# EAGLE design LPC_4TE_TOP (EAGLE 5.04)
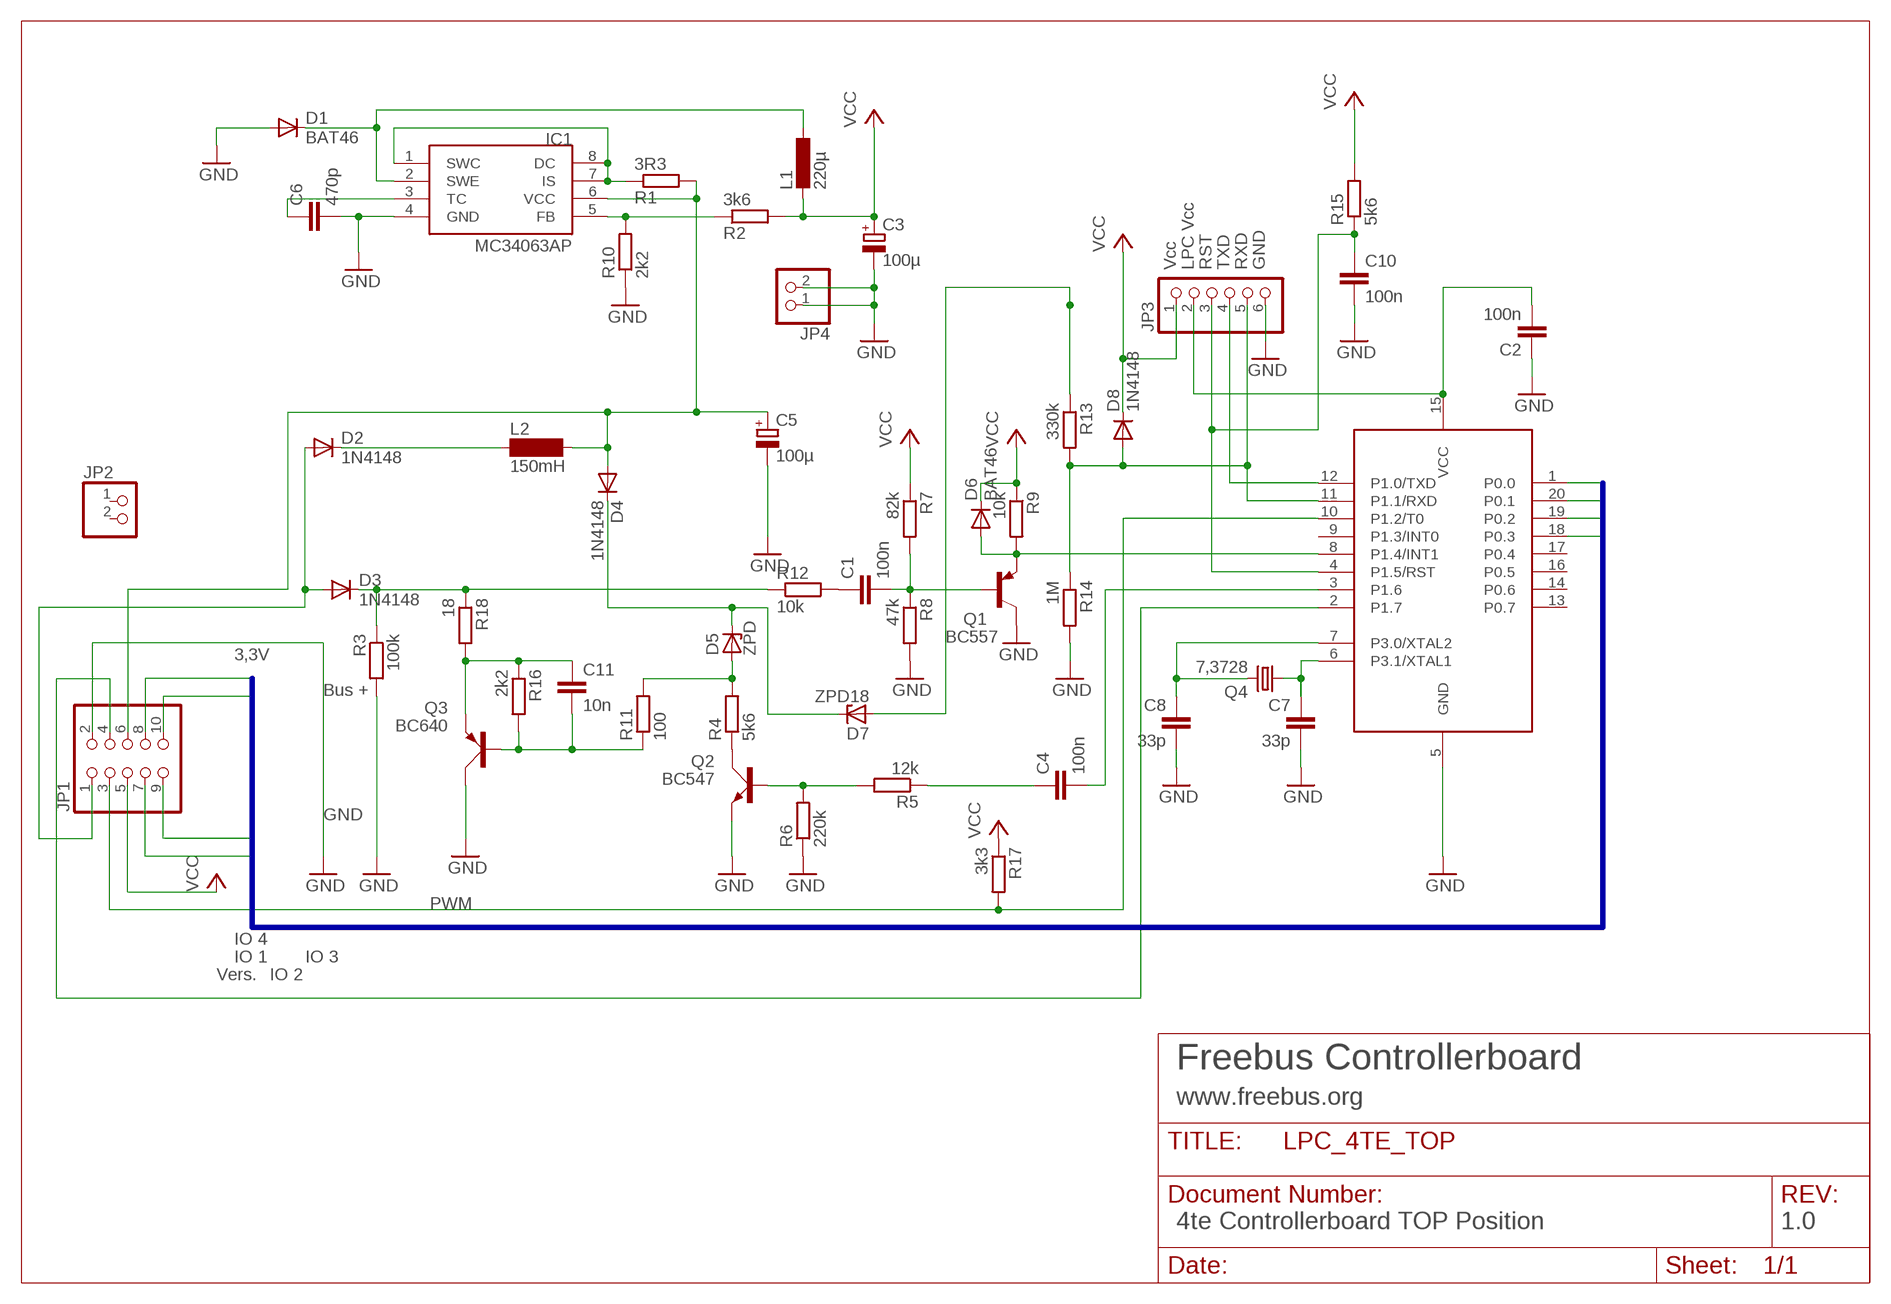
[diagram p0: schematic, sheet 1]

## Parts
89LPC922  89LPC922  [DIL20]
C1  100n  C-EU050-024X044  [C050-024X044]
C2  100n  C-EU050-024X044  [C050-024X044]
C3  100µ  CPOL-EUE2.5-6  [E2,5-6]
C4  100n  C-EU050-024X044  [C050-024X044]
C5  100µ  CPOL-EUE3.5-8  [E3,5-8]
C6  470p  C-EU025-024X044  [C025-024X044]
C7  33p  C-EU025-024X044  [C025-024X044]
C8  33p  C-EU025-024X044  [C025-024X044]
C10  100n  C-EU050-024X044  [C050-024X044]
C11  10n  C-EU050-024X044  [C050-024X044]
D1  BAT46  BAT81  [DO34-7]
D2  1N4148  [DO35-10]
D3  1N4148  [DO35-10]
D4  1N4148  [DO35-10]
D5  ZPD  [DO35Z10]
D6  BAT46  1N4148  [DO35-10]
D7  ZPD18  ZPD  [DO35Z10]
D8  1N4148  [DO35-10]
IC1  MC34063AP  [DIL08]
JP1  PINHD-2X5  [2X05]
JP2  PINHD-1X2  [1X02]
JP3  PINHD-1X6  [1X06]
JP4  PINHD-1X2  [1X02]
L1  220µ  L-EU0207/12  [0207/12]
L2  150mH  BS11  [BS11]
Q1  BC557  [TO92]
Q2  BC547  [SOT54A]
Q3  BC640  [SOT54D]
Q4  7,3728  CRYSTALHC49S  [HC49/S]
R1  3R3  R-EU_0204/7  [0204/7]
R2  3k6  R-EU_0204/7  [0204/7]
R3  100k  R-EU_0207/2V  [0207/2V]
R4  5k6  R-EU_0207/2V  [0207/2V]
R5  12k  R-EU_0204/7  [0204/7]
R6  220k  R-EU_0207/2V  [0207/2V]
R7  82k  R-EU_0204/7  [0204/7]
R8  47k  R-EU_0207/2V  [0207/2V]
R9  10k  R-EU_0204/7  [0204/7]
R10  2k2  R-EU_0204/7  [0204/7]
R11  100  R-EU_0207/2V  [0207/2V]
R12  10k  R-EU_0207/2V  [0207/2V]
R13  330k  R-EU_0207/2V  [0207/2V]
R14  1M  R-EU_0207/2V  [0207/2V]
R15  5k6  R-EU_0207/2V  [0207/2V]
R16  2k2  R-EU_0207/2V  [0207/2V]
R17  3k3  R-EU_0204/7  [0204/7]
R18  18  R-EU_0207/2V  [0207/2V]

## Nets
/RESET: 89LPC922.4(P1.5/RST) C10.1 JP3.3 R15.1
EIB+: D2.A D3.A JP1.1
GND: 89LPC922.5(GND) C2.1 C3.- C5.- C6.2 C7.2 C8.2 C10.2 D1.A IC1.4(GND) JP1.2 JP3.6 JP4.1 JP4.2 Q1.3(C) Q2.E Q3.C R3.2 R6.1 R8.2 R10.1 R14.2
N$1: 89LPC922.8(P1.4/INT1) D6.A Q1.1(E) R9.2
N$2: C1.2 Q1.2(B) R7.2 R8.1
N$3: 89LPC922.7(P3.0/XTAL2) C8.1 Q4.2
N$4: D3.C R3.1 R12.1 R18.1
N$5: 89LPC922.3(P1.6) C4.2
N$6: 89LPC922.6(P3.1/XTAL1) C7.1 Q4.1
N$7: Q2.B R5.2 R6.2
N$8: IC1.1(SWC) IC1.7(IS) IC1.8(DC) R1.1
N$10: 89LPC922.11(P1.1/RXD) D8.A JP3.5 R13.2 R14.1
N$11: IC1.5(FB) R2.1 R10.2
N$12: D1.C IC1.2(SWE) L1.1
N$13: D2.C L2.1
N$14: C6.1 IC1.3(TC)
N$15: D4.C D5.C D7.C
N$16: C1.1 R12.2
N$17: C4.1 R5.1
N$18: Q2.C R4.1
N$19: D5.A R4.2 R11.2
N$20: C11.1 Q3.E R16.1 R18.2
N$25: D7.A R13.1
N$28: C11.2 Q3.B R11.1 R16.2
N$29: 89LPC922.12(P1.0/TXD) JP3.4
N$32: 89LPC922.15(VCC) C2.2 JP3.2
P0.0: 89LPC922.1(P0.0) JP1.7
P0.1: 89LPC922.20(P0.1) JP1.8
P0.2: 89LPC922.19(P0.2) JP1.9
P0.3: 89LPC922.18(P0.3) JP1.10
PROG: 89LPC922.2(P1.7) JP1.4
PWM: 89LPC922.10(P1.2/T0) JP1.3 R17.2
VCC: C3.+ D6.C D8.C JP1.5 JP3.1 L1.2 R2.2 R7.1 R9.1 R15.2 R17.1
VERS: C5.+ D4.A IC1.6(VCC) JP1.6 L2.2 R1.2
Unconnected: 89LPC922.9(P1.3/INT0) 89LPC922.13(P0.7) 89LPC922.14(P0.6) 89LPC922.16(P0.5) 89LPC922.17(P0.4) JP2.1 JP2.2

## Buses
P0.[0..3]

## Notes on the sheet
- Vcc | LPC Vcc | RST | TXD | RXD | GND
- 3,3V
- Bus +
- GND
- PWM
- IO 4
- IO 1 | IO 3
- Vers. | IO 2
- Freebus Controllerboard
- www.freebus.org
- 4te Controllerboard TOP Position | 1.0

## Library data of the parts
89LPC922 = micro-philips:89LPC922
C1 C2 C4 C6-C8 C10 C11 = rcl:C-EU: CAPACITOR, European symbol
C3 C5 = rcl:CPOL-EU: POLARIZED CAPACITOR, European symbol
D1 = diode:BAT81: DIODE barrier diode
D2-D4 D6 D8 = diode:1N4148: DIODE high speed (Philips)
D5 D7 = diode:ZPD: Z DIODE 500 mW
IC1 = mc34063:MC34063
JP1 = pinhead:PINHD-2X5: PIN HEADER
JP2 JP4 = pinhead:PINHD-1X2: PIN HEADER
JP3 = pinhead:PINHD-1X6: PIN HEADER
L1 = rcl:L-EU: INDUCTOR, European symbol
L2 = inductor-neosid:BS: INDUCTOR nominal inductance, magnetically screened
Q1 = transistor-pnp:BC557: PNP Transistor
Q2 = transistor-small-signal:BC547: NPN TRANSISTOR
Q3 = transistor-small-signal:BC640: PNP TRANSISTOR
Q4 = crystal:CRYSTAL: CRYSTAL
R1-R18 = rcl:R-EU_: RESISTOR, European symbol

## Board
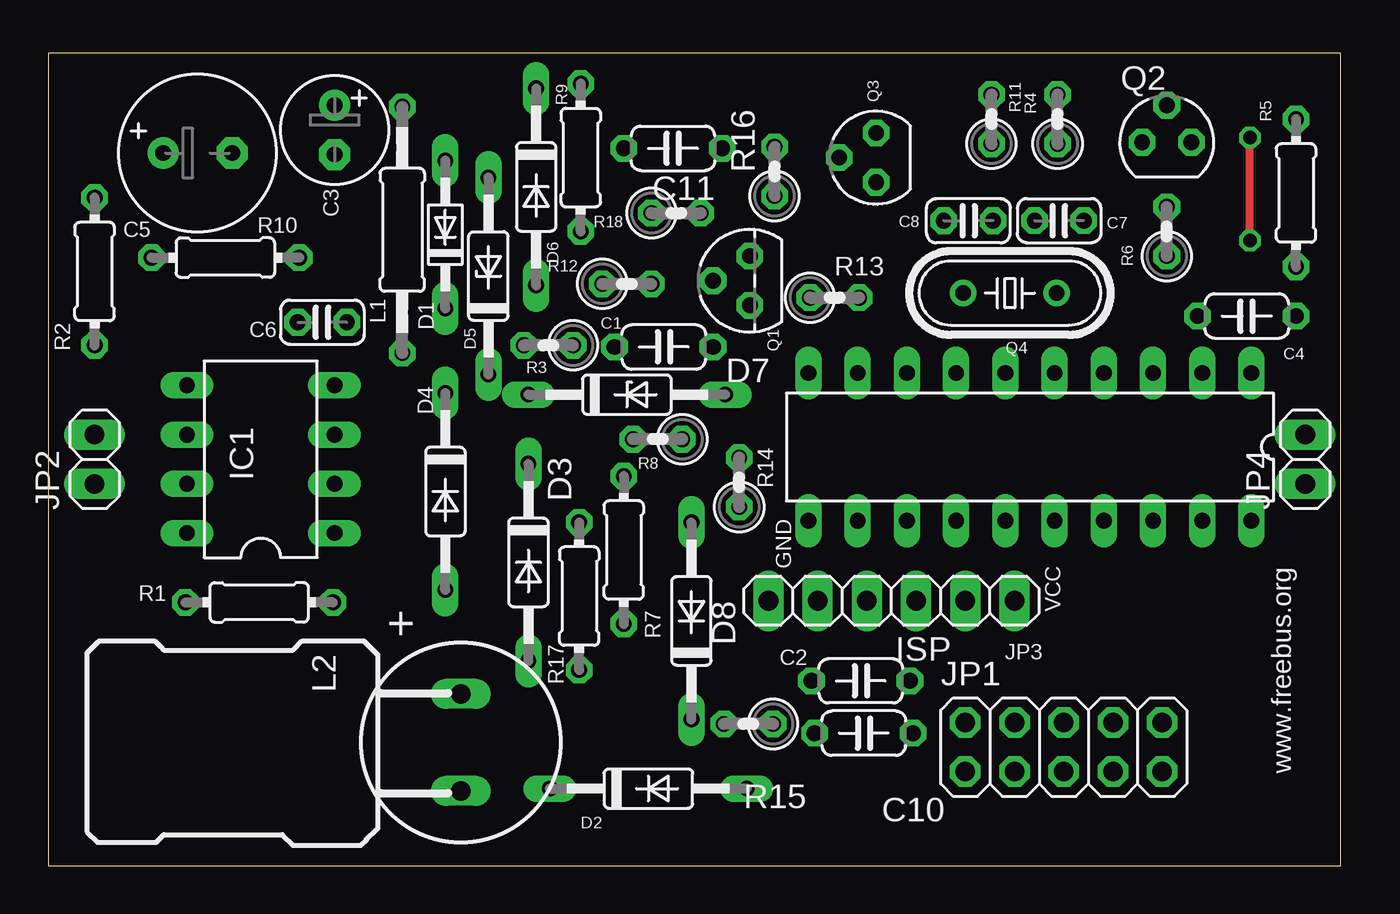
[diagram p1: board, top side]
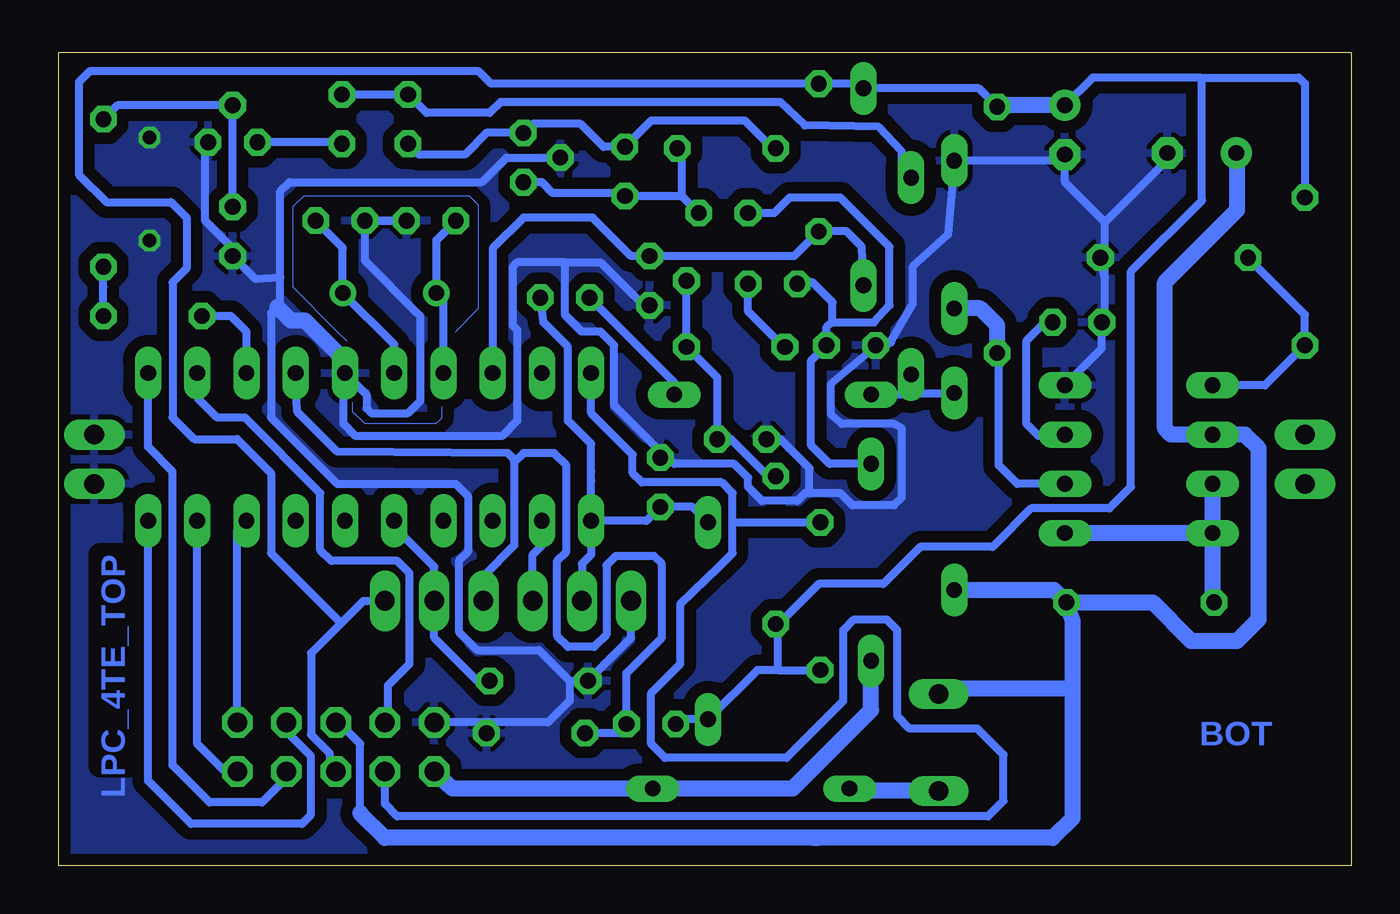
[diagram p2: board, bottom side, seen from below]

Size 66.68 x 41.91 mm. Coordinates in mm from the lower left corner, seen from the top.
Outline: 0,41.91 0,0 66.68,0 66.68,41.91 0,41.91
Copper layers (1*16): Top 0.035mm / dielectric 1.5mm / Bottom 0.035mm
Design rules "default_freebus": minimum track width 10mil, minimum drill 24mil, track to track 8mil, track to pad 8mil, pad to pad 8mil, via to via 8mil, smd to smd 8mil, copper to edge 12mil, drill to drill 8mil, minimum pad ring 11mil, minimum via ring 8mil, stop-mask expansion 4mil, vias tented up to drill 0mil, thermal gap 10mil

### Footprints (pad centres in the part's own frame; a part is rotated, then mirrored left to right if it is on the bottom)
DIL20@1 = drill 0.813 long: 1 -11.43,-3.81; 2 -8.89,-3.81; 3 -6.35,-3.81; 4 -3.81,-3.81; 5 -1.27,-3.81; 6 1.27,-3.81; 7 3.81,-3.81; 8 6.35,-3.81; 9 8.89,-3.81; 10 11.43,-3.81; 11 11.43,3.81; 12 8.89,3.81; 13 6.35,3.81; 14 3.81,3.81; 15 1.27,3.81; 16 -1.27,3.81; 17 -3.81,3.81; 18 -6.35,3.81; 19 -8.89,3.81; 20 -11.43,3.81
C050-024X044 = drill 0.813 octagon: 1 -2.54,0; 2 2.54,0
E2,5-6 = drill 0.813 pad 1.6 round: + -1.27,0 | drill 0.813 pad 1.6 octagon: - 1.27,0
E3,5-8 = drill 0.813 pad 1.6 round: + -1.778,0 | drill 0.813 pad 1.6 octagon: - 1.778,0
C025-024X044 = drill 0.813 octagon: 1 -1.27,0; 2 1.27,0
DO34-7 = drill 0.813 long: A 3.81,0; C -3.81,0
DO35-10 = drill 0.813 long: A 5.08,0; C -5.08,0
DO35Z10 = drill 0.813 long: A 5.08,0; C -5.08,0
DIL08 = drill 0.813 long: 1 -3.81,-3.81; 2 -1.27,-3.81; 3 1.27,-3.81; 4 3.81,-3.81; 5 3.81,3.81; 6 1.27,3.81; 7 -1.27,3.81; 8 -3.81,3.81
2X05 = drill 1.016 octagon: 1 -5.08,-1.27; 2 -5.08,1.27; 3 -2.54,-1.27; 4 -2.54,1.27; 5 0,-1.27; 6 0,1.27; 7 2.54,-1.27; 8 2.54,1.27; 9 5.08,-1.27; 10 5.08,1.27
1X02 = drill 1.016 long: 1 -1.27,0; 2 1.27,0
1X06 = drill 1.016 long: 1 -6.35,0; 2 -3.81,0; 3 -1.27,0; 4 1.27,0; 5 3.81,0; 6 6.35,0
0207/12 = drill 0.813 octagon: 1 -6.35,0; 2 6.35,0
BS11 = drill 1 long: 1 -2.5,0; 2 2.5,0
TO92 = drill 0.813 octagon: 1 1.27,0; 2 0,1.905; 3 -1.27,0
SOT54A = drill 0.813 octagon: B 0,1.905; C -1.27,0; E 1.27,0
SOT54D = drill 0.813 octagon: B 1.27,0; C 0,1.905; E -1.27,0
HC49/S = drill 0.813 round: 1 -2.413,0; 2 2.413,0
0204/7 = drill 0.813 octagon: 1 -3.81,0; 2 3.81,0
0207/2V = drill 0.813 octagon: 1 -1.27,0; 2 1.27,0

### Placement (x,y rotation side)
89LPC922  89LPC922  [DIL20@1]  50.64,21.59 180 top
C1  31.75,26.75 0 top
C2  41.91,9.53 0 top
C3  14.76,37.94 270 top
C4  61.83,28.34 180 top
C5  7.7,36.75 0 top
C6  14.13,28.02 180 top
C7  52.15,33.26 180 top
C8  47.47,33.26 0 top
C10  42.07,6.83 0 top
C11  32.23,36.99 180 top
D1  20.48,32.54 90 top
D2  30.96,3.97 0 top
D3  24.76,15.64 270 top
D4  20.48,19.29 270 top
D5  22.7,30.4 90 top
D6  25.16,35.01 270 top
D7  29.84,24.29 0 top
D8  33.18,12.62 90 top
IC1  10.95,20.96 90 top
JP1  52.39,6.11 0 top
JP2  2.38,20.96 90 top
JP3  43.5,13.65 180 top
JP4  64.85,20.96 90 top
L1  18.26,32.78 90 top
L2  21.27,6.35 90 top
Q1  36.19,30.16 90 top
Q2  57.7,37.31 0 top
Q3  42.7,36.51 90 top
Q4  49.61,29.53 180 top
R1  10.87,13.57 0 top
R2  2.38,30.64 90 top
R3  25.8,26.83 180 top
R4  52.07,38.5 90 top
R5  64.37,34.69 90 top
R6  57.7,32.7 90 top
R7  29.69,16.27 90 top
R8  31.43,21.99 180 top
R9  27.46,36.51 270 top
R10  9.13,31.35 180 top
R11  48.66,38.5 90 top
R12  29.84,30 0 top
R13  40.56,29.29 0 top
R14  35.64,19.76 90 top
R15  36.12,7.3 180 top
R16  37.46,35.8 90 top
R17  27.38,13.89 90 top
R18  32.38,33.66 0 top

### Tracks (layer width: path | path; a pad name or v marks a point on that pad's centre or on a via)
/RESET
  Bottom 0.406: 89LPC922.4 54.37,23.42 52.31,21.35 43.5,21.27 43.18,20.96 43.18,20.8 | 43.18,20.8 43.18,16.51 44.77,14.92 JP3.3 | 43.18,20.8 42.7,21.27 41.12,21.27 40.48,20.64 40.48,16.19 40.96,15.72 40.96,11.83 40.4,11.27 39.05,11.27 38.42,11.91 38.42,15.48 37.94,15.95 35.96,15.95 35.56,15.56 35.56,11.75 37.39,9.92 R15.1 37.31,6.83 C10.1
EIB+
  Bottom 0.813: JP1.1 46.35,3.97 40.8,3.97 D2.A 28.81,3.97 24.76,8.02 D3.A 24.76,10.24
GND  (via drill 0.7)  (1 unrouted)
  Top 0.406: v61.99,32.23 v61.99,37.54
  Bottom 0.406: 40.32,9.53 40.32,8.49 41.43,7.38 44.61,7.38 | 40.32,9.53 41.91,11.11 45.08,11.11 46.04,12.07 46.04,12.54 46.04,15.72 45.56,16.19 45.56,19.05 46.2,19.69 52.31,19.69 55.72,23.1 55.72,28.5 55.4,28.81 55.24,28.97 55.24,30.32 | 44.61,7.38 JP1.2 | JP1.2 | 89LPC922.5 51.91,25.72 | 12.7,33.18 14.76,35.24 C3.- 15.08,36.35 D1.A 20.8,32.54 22.62,30.88 22.62,28.97 23.73,27.07 | 12.7,30.32 12.7,33.18 | 12.7,30.32 R10.1 | C5.- 9.48,36.4 12.7,33.18 | C10.2 | 44.61,7.38 C10.2 | JP3.6 37.15,11.75 C2.1 40.32,9.53 | C7.2 C8.2 50.48,33.26 | C7.2 | R8.2 30.16,21.91 30.08,21.99 29.45,21.99 27.94,20.48 27.94,19.21 | R3.2 23.97,26.83 23.73,27.07 | 23.73,27.07 23.73,26.99 24.29,26.99 26.83,24.84 26.83,23.26 26.27,22.78 23.57,22.78 23.18,22.54 23.18,18.97 23.57,18.57 25.72,18.57 26.35,19.21 27.94,19.21 | IC1.4 12.86,26.67 C6.2 12.7,28.18 12.7,30.32 | Q3.C 43.58,36.51 44.85,35.24 54.77,35.24 55.24,34.77 55.24,30.32 | C7.2 | C7.2 50.88,31.19 48.18,28.5 48.02,28.34 48.02,23.97 48.66,23.34 50.56,23.34 50.8,23.57 50.8,24.29 89LPC922.5 | 89LPC922.5 51.99,25.32 51.99,22.78 51.35,22.15 43.81,22.15 43.02,22.94 43.02,27.62 43.26,27.86 43.26,30.88 43.02,31.12 40.56,31.12 | 89LPC922.5 | 55.24,30.32 56.51,30.24 R6.1 57.71,31.83 59.13,33.26 59.13,37.15 Q2.E | 40.32,9.53 | 27.94,19.21 28.18,19.21 28.57,18.81 30.4,18.81 31.11,19.53 31.11,20 31.83,20.72 34.92,20.72 35.24,21.03 R14.2 35.64,21.35 38.02,23.73 38.02,26.83 38.73,27.54 39.69,27.54 40.56,28.42 40.56,31.12 | Q1.3 36.51,28.89 38.73,31.12 40.56,31.12
  Bottom 0.813: 51.91,25.72 51.91,26.04 53.97,28.1 54.69,28.1 55.4,28.81
  pour Bottom (isolate 0.61): 0,42.23 67.15,42.23 67.15,-0.32 -0.4,-0.32 -0.4,41.99
N$1
  Bottom 0.406: 89LPC922.8 44.29,25.88 | 44.29,25.88 | 44.29,25.96 89LPC922.8 | 44.29,25.96 44.29,26.35 44.29,27.78 44.29,31.83 42.7,33.42 39.13,33.42 37.15,31.43 Q1.1 33.65,31.43 33.34,31.43 31.91,31.43 31.59,31.43 30.96,31.43 30.8,31.43 28.73,31.43 R9.2 26.03,32.7 25.24,31.91 D6.A | 89LPC922.8 44.21,25.48 | 44.53,25.88 44.37,25.88 44.29,25.96
N$2
  Bottom 0.406: Q1.2 34.29,27.46 C1.2 32.7,25.16 R8.1 31.99,21.99 30.08,20.08 R7.2
N$3
  Bottom 0.406: 89LPC922.7 46.83,29.16 Q4.2 47.2,32.26 C8.1
N$4
  Bottom 0.406: R12.1 28.26,30.08 27.78,30.08 26.75,29.05 26.75,28.02 | 26.75,28.02 24.61,28.02 23.81,28.89 23.81,31.91 26.35,34.45 28.97,34.45 29.77,33.66 R18.1 | 26.75,28.02 27.07,27.78 R3.1 27.86,26.04 27.86,21.67 26.91,20.72 D3.C
N$5
  Bottom 0.406: 89LPC922.3 56.99,27.54 57.78,28.34 C4.2
N$6
  Bottom 0.406: 89LPC922.6 49.37,26.88 Q4.1 52.02,31.86 C7.1
N$7
  Bottom 0.406: R5.2 63.66,39.21 Q2.B | Q2.B | R6.2 Q2.B
N$8
  Bottom 0.813: IC1.8 IC1.1 | IC1.8 IC1.7 | IC1.8 7.14,13.42 R1.1
N$9
  Bottom 0: 51.51,23.89 51.51,23.42 50.88,22.78 47.23,22.78 46.91,23.1 46.91,23.65
N$10
  Bottom 0.406: JP3.5 39.69,15.56 39.21,16.03 89LPC922.11 | 89LPC922.11 39.21,19.84 39.21,20.32 39.21,21.75 40.4,22.94 40.4,26.75 41.67,28.02 R13.2 | 89LPC922.11 36.35,17.78 R14.1 33.97,18.49 D8.A
N$11
  Bottom 0.406: R10.2 2.38,28.42 R2.1 4.45,24.77 IC1.5
N$12
  Bottom 0.406: IC1.2 17.22,19.68 18.18,20.64 18.18,26.43 L1.1
  Bottom 0.813: L1.1 18.26,27.86 19.13,28.73 D1.C | D1.C
N$13
  Bottom 0.813: D2.C 25.76,3.85 L2.1
N$14
  Bottom 0.406: IC1.3 14.84,22.15 16.11,22.15 16.75,22.78 16.75,27.07 15.8,28.02 C6.1
N$15
  Bottom 0.406: D7.C 22.7,24.29 22.7,24.37 | 22.7,24.37 D4.C | D5.C 22.7,24.37
N$16
  Bottom 0.406: C1.1 29.29,26.75 31.11,28.58 R12.2
N$17
  Bottom 0.406: R5.1 64.37,29.84 C4.1
N$18
  Bottom 0.406: R4.1 52.15,37.31 Q2.C
N$19
  Bottom 0.406: D5.A 23.18,36.2 23.18,36.83 24.37,38.1 28.18,38.18 29.45,39.37 43.89,39.37 44.45,38.81 47.7,38.81 R11.2 51.75,39.77 R4.2
N$20
  Bottom 0.406: R18.2 34.53,34.53 | 34.53,34.53 R16.1 37.62,34.69 41.2,34.69 41.75,35.24 Q3.E | C11.1 34.53,36.75 34.53,34.53
N$21
  Bottom 0: 51.83,27.07 52.31,27.54 54.61,29.85 54.61,33.97 54.05,34.53 45.48,34.53 45.01,34.05 45.01,28.73 46.2,27.54
N$25
  Bottom 0.406: R13.1 34.92,24.92 D7.A
N$28
  Bottom 0.406: R11.1 48.1,36.67 45.72,36.67 44.61,37.78 Q3.B 42.23,38.26 39.77,38.26 38.58,37.07 R16.2 36.12,38.42 31.27,38.42 29.84,36.99 C11.2
N$29
  Bottom 0.406: JP3.4 42.23,16.03 41.75,16.51 89LPC922.12
N$32
  Bottom 0.406: JP3.2 47.31,15.4 49.37,17.46 89LPC922.15 | JP3.2 47.31,14.61 47.31,13.34 | C2.2 45.08,9.53 47.31,11.75 JP3.2
P0.0
  Bottom 0.406: JP1.7 54.93,4.52 56.2,3.25 58.9,3.25 60.8,5.16 60.8,20.32 62.07,21.59 89LPC922.1
P0.1
  Bottom 0.406: JP1.8 54.93,6.91 53.66,5.64 53.66,2.62 54.13,2.14 59.85,2.14 62.07,4.37 89LPC922.20
P0.2
  Bottom 0.406: JP1.9 58.1,4.84 59.53,6.27 89LPC922.19
P0.3
  Bottom 0.406: JP1.10 57.47,17.3 89LPC922.18
PROG
  Bottom 0.406: 89LPC922.2 59.53,24.13 58.5,23.1 57.07,23.1 53.18,19.21 53.18,16.27 52.63,15.72 49.21,15.72 48.58,15.08 48.58,10.4 49.69,9.29 49.69,7.54 JP1.4 50.01,7.54
PWM
  Bottom 0.406: JP1.3 49.85,3.18 49.21,2.54 18.73,2.54 17.94,3.33 17.94,5.72 19.29,7.06 22.78,7.06 23.42,7.7 23.42,12.14 23.97,12.7 25.64,12.7 26.19,12.14 26.19,8.49 26.43,8.26 29.13,5.56 35.4,5.56 36.12,6.27 36.12,8.89 34.61,10.4 34.61,13.49 32.62,15.4 31.91,16.11 31.91,17.7 | 89LPC922.10 39.21,23.34 37.07,21.19 37.07,20.24 36.59,19.76 32.46,19.76 31.91,19.21 31.91,17.7 | R17.2 31.91,17.7
VCC
  Bottom 0.406: C3.+ 13.33,40.64 7.78,40.64 | 25.24,40.32 R9.1 44.37,40.32 45.01,40.96 65.09,40.96 65.64,40.4 65.64,35.64 64.21,34.21 60.88,34.21 60.09,33.42 60.09,30.8 60.8,30.08 60.8,23.1 59.69,21.99 57.47,21.99 55.72,20.24 55.72,16.11 52.19,12.58 52.03,12.58 | JP3.1 50.96,13.65 52.03,12.58 | 52.03,12.58 53.66,10.95 53.66,6.75 52.7,5.79 52.7,5.16 JP1.5 | 7.78,40.64 2.7,40.64 2.38,40.32 2.38,37.07 R2.2 | 7.78,40.64 7.7,40.56 7.7,34.29 11.35,30.64 11.35,19.53 12.46,18.42 16.51,18.42 18.41,16.51 18.49,16.43 22.22,16.43 24.13,14.53 27.46,14.53 29.53,12.46 R7.1 29.61,12.38 29.61,10.08 | 25.24,40.32 D6.C 19.21,40.08 L1.2 | 25.24,40.32 25.16,40.32 | R15.2 34.61,7.54 D8.C 30.64,10.08 29.61,10.08 | 29.61,10.08 R17.1
  Bottom 0.813: C3.+ 18.18,39.21 L1.2
VERS
  Bottom 0.406: IC1.6 | IC1.6 | JP1.6 52.23,7.38 51.12,6.27 51.12,2.7
  Bottom 0.813: 51.12,2.7 49.85,1.43 27.7,1.43 | 27.7,1.43 27.54,1.43 | R1.2 10.24,13.57 8.25,11.59 5.87,11.59 4.76,12.7 4.76,21.51 5.48,22.23 IC1.6 | IC1.6 | 14.37,9.13 14.37,2.46 15.4,1.43 27.7,1.43 | 14.37,9.13 14.37,12.62 R1.2 | IC1.6 9.29,22.23 9.6,22.54 9.6,30.08 5.87,33.81 5.87,36.7 C5.+ | R1.2 15.32,14.21 D4.A | L2.2 20.99,9.13 14.37,9.13

### Text on the board
Bottom: LPC_4TE_TOP | BOT
tPlace: +
tNames: GND | www.freebus.org | VCC | ISP